# Altium schematic sheet RS485_RS232_Sheet.SchDoc
size A4; DocumentNumber: 6; SheetNumber: 6; SheetTotal: 10
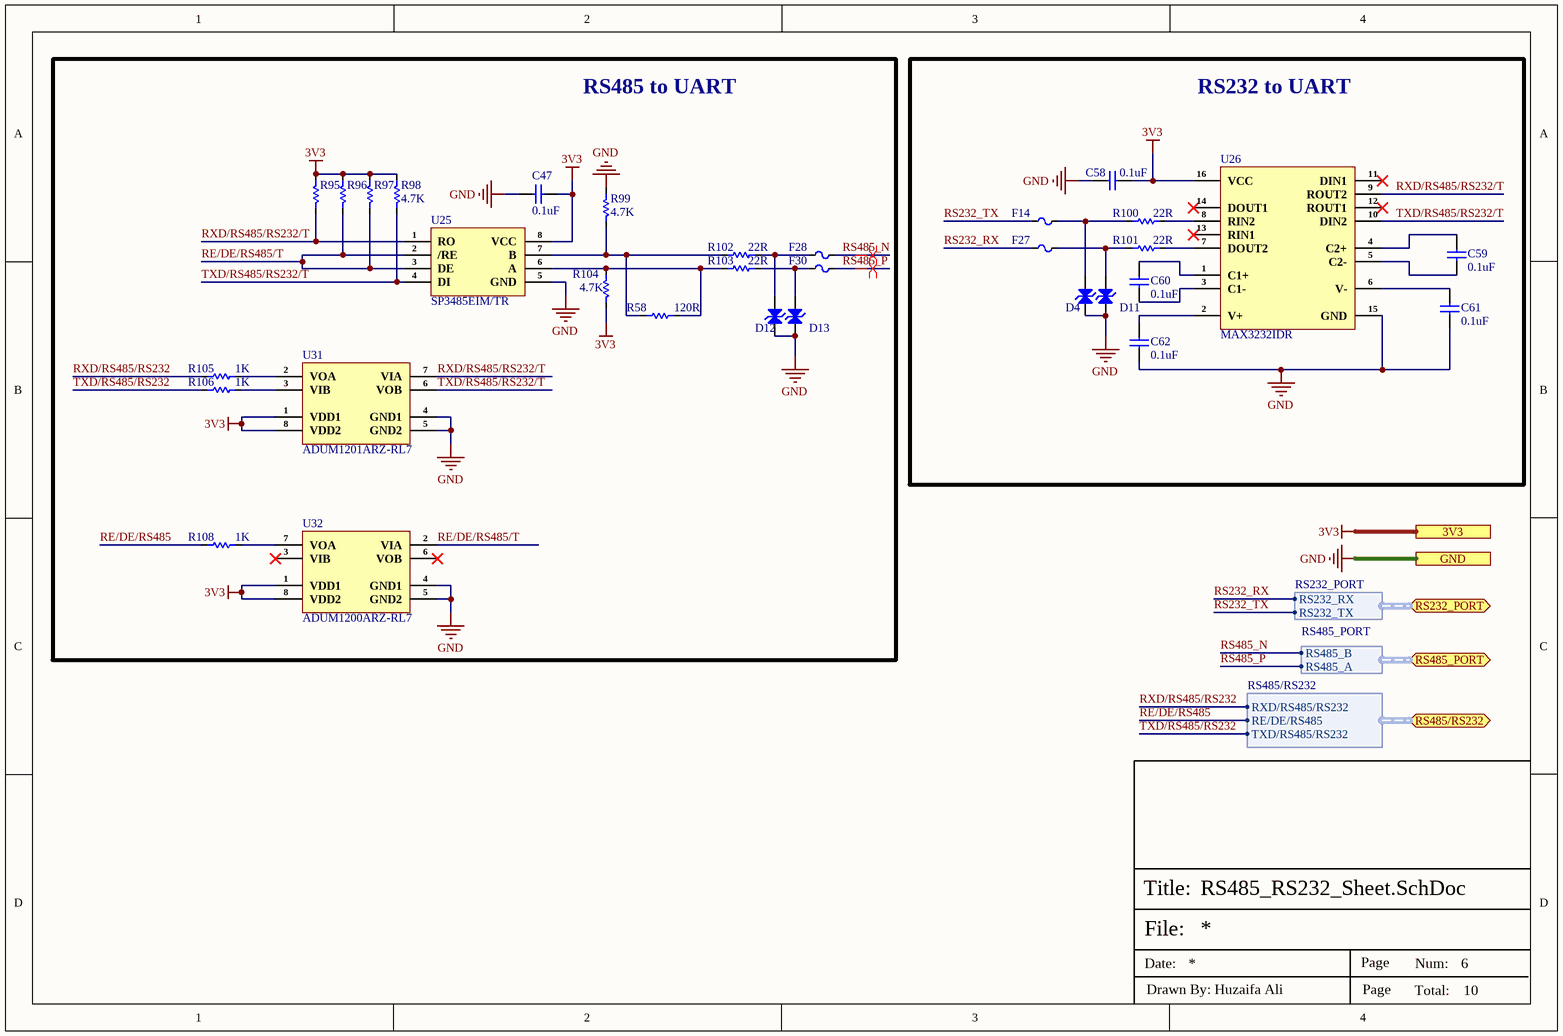
[diagram p0: RS485_RS232_Sheet.SchDoc]

## Parts
C47  0.1uF  [Cap-0603]
C58  0.1uF  [Cap-0603]
C59  0.1uF  [Cap-0603]
C60  0.1uF  [Cap-0603]
C61  0.1uF  [Cap-0603]
C62  0.1uF  [Cap-0603]
D4  SMBJ26CA  [SMB_]  (value not drawn)
D11  SMBJ26CA  [SMB_]  (value not drawn)
D12  SMBJ26CA  [SMB_]  (value not drawn)
D13  SMBJ26CA  [SMB_]  (value not drawn)
F14  SMD0805P020TF  [Fuse-0805]  (value not drawn)
F27  SMD0805P020TF  [Fuse-0805]  (value not drawn)
F28  SMD0805P020TF  [Fuse-0805]  (value not drawn)
F30  SMD0805P020TF  [Fuse-0805]  (value not drawn)
R58  120R  [Res-0603]
R95  4.7K  [Res-0603]  (value not drawn)
R96  4.7K  [Res-0603]  (value not drawn)
R97  4.7K  [Res-0603]  (value not drawn)
R98  4.7K  [Res-0603]
R99  4.7K  [Res-0603]
R100  22R  [Res-0603]
R101  22R  [Res-0603]
R102  22R  [Res-0603]
R103  22R  [Res-0603]
R104  4.7K  [Res-0603]
R105  1K  [Res-0603]
R106  1K  [Res-0603]
R108  1K  [Res-0603]
U25  SP3485EIM/TR  [SOP-8]
U26  MAX3232IDR  [SOIC-16]
U31  ADUM1201ARZ-RL7  [SOIC-8]
U32  ADUM1200ARZ-RL7  [SOIC-8]

## Blocks framed on the sheet
RS485 to UART: C47 D12 D13 F28 F30 R58 R95-R99 R102-R106 R108 U25 U31 U32
RS232 to UART: C58-C62 D4 D11 F14 F27 R100 R101 U26

## Ports
3V3, GND, RS232_PORT (bidir, harness RS232_PORT), RS485/RS232 (bidir, harness RS485/RS232), RS485_PORT (bidir, harness RS485_PORT)

## Harnesses
RS485_PORT: RS485_B, RS485_A
RS232_PORT: RS232_RX, RS232_TX
RS485/RS232: RXD/RS485/RS232, RE/DE/RS485, TXD/RS485/RS232

## Nets
3V3: C47.2 C58.2 R95.1 R96.1 R97.1 R98.1 R104.2 U25.8(VCC) U26.16(VCC) U31.1(VDD1) U31.8(VDD2) U32.1(VDD1) U32.8(VDD2) ; port 3V3
GND: C47.1 C58.1 C61.2 C62.2 D4.1(A) D11.1(A) D12.1(A) D13.1(A) R99.1 U25.5(GND) U26.15(GND) U31.4(GND1) U31.5(GND2) U32.4(GND1) U32.5(GND2) ; port GND
RE/DE/RS485: R108.2 ; port RS485/RS232.RE/DE/RS485
RE/DE/RS485/T: R96.2 R97.2 U25.2(/RE) U25.3(DE) U32.2(VIA)
RS232_RX: F27.1 ; port RS232_PORT.RS232_RX
RS232_TX: F14.1 ; port RS232_PORT.RS232_TX
RS485_N: F28.2 ; port RS485_PORT.RS485_B
RS485_P: F30.2 ; port RS485_PORT.RS485_A
RXD/RS485/RS232: R105.2 ; port RS485/RS232.RXD/RS485/RS232
RXD/RS485/RS232/T: R95.2 U25.1(RO) U26.9(ROUT2) U31.7(VIA)
TXD/RS485/RS232: R106.2 ; port RS485/RS232.TXD/RS485/RS232
TXD/RS485/RS232/T: R98.2 U25.4(DI) U26.10(DIN2) U31.6(VOB)
NetC59_1: C59.1 U26.4(C2+)
NetC59_2: C59.2 U26.5(C2-)
NetC60_1: C60.1 U26.1(C1+)
NetC60_2: C60.2 U26.3(C1-)
NetC61_1: C61.1 U26.6(V-)
NetC62_1: C62.1 U26.2(V+)
NetD4_2: D4.2(K) F14.2 R100.1
NetD11_2: D11.2(K) F27.2 R101.1
NetD12_2: D12.2(K) F28.1 R102.2
NetD13_2: D13.2(K) F30.1 R103.2
NetR58_1: R58.1 R99.2 R102.1 U25.7(B)
NetR58_2: R58.2 R103.1 R104.1 U25.6(A)
NetR100_2: R100.2 U26.8(RIN2)
NetR101_2: R101.2 U26.7(DOUT2)
NetR105_1: R105.1 U31.2(VOA)
NetR106_1: R106.1 U31.3(VIB)
NetR108_1: R108.1 U32.7(VOA)

Not connected (* = marked no-connect by the designer): U26 11(DIN1)* 12(ROUT1)* 13(RIN1)* 14(DOUT1)*; U32 3(VIB)* 6(VOB)*

## Layout directives
differential pair; net class RS485; differential pair class RS485_LINES; rule Impedance Constraint [Min = 115.0    Max = 120.0    ]; rule Matched Net Lengths [Tolerance = 0.508mm]: RS485_N, RS485_P

## Notes on the sheet
- File:
- Title:
- Date:
- Page
- Num:
- Total:
- Drawn By: Huzaifa Ali

## Library data of the parts
C47 C58-C62 = CC0603KRX5R9BB104: CAP CER 0.1UF 50V X5R 0603; Manufacturer: Yageo; Capacitance: 100nF; Tolerance: 10%; Item Type: Capacitor; Supplier 1: Digi-Key; Manufacturer Part Number: CC0603KRX5R9BB104; RoHS: Yes; Category: Ceramic Capacitors; Stock 1: 152253; Pricing 1: 1=0.10000, 10=0.05200, 50=0.02820, 100=0.02310, 500=0.01648, 1000=0.01294 (USD); Mount: Surface Mount; Case/Package: 0603; Case Code (Imperial): 0603; Case Code (Metric): 1608; Weight: 7.1E-05oz; Min Operating Temperature: -55°C; Max Operating Temperature: 85°C; Packaging: Tape and Reel; Voltage Rating: 50V; Dielectric: X5R; Termination: SMD/SMT; Voltage Rating (DC): 50V; Package Quantity: 4000; Length: 0.063inch; Width: 0.031inch; Thickness: 0.035inch; Lead Free: Lead Free; Halogen Free: Halogen Free; ComponentLink1URL: http://www.mouser.com/ds/2/447/Yageo_UPY-GP_NP0_16V-to-50V_9-358835.pdf?src-supplier=Mouser; ComponentLink1Description: http://www.mouser.com/ds/2/447/Yageo_UPY-GP_NP0_16V-to-50V_9-358835.pdf?src-supplier=Mouser; ComponentLink2URL: https://www.yageo.com/upload/media/product/productsearch/datasheet/mlcc/UPY-GPHC_X5R_4V-to-50V_26.pdf?src-supplier=Digi-Key; ComponentLink2Description: https://www.yageo.com/upload/media/product/productsearch/datasheet/mlcc/UPY-GPHC_X5R_4V-to-50V_26.pdf?src-supplier=Digi-Key; ComponentLink3URL: http://www.yageo.com/exep/pages/download/literatures/ProductSelectionGuide%202014_Final_2.pdf?src-supplier=Digi-Key; ComponentLink3Description: http://www.yageo.com/exep/pages/download/literatures/ProductSelectionGuide%202014_Final_2.pdf?src-supplier=Digi-Key; Supplier Part Number 1: 311-4046-1-ND; LCSC Part Number: C110022
D4 D11-D13 = SMBJ26CA: SMB(DO-214AA) TVS ROHS; Manufacturer: MSKSEMI; Item Type: Diode; Manufacturer Part Number: SMBJ26CA; Package: SMB(DO-214AA); LCSC Part Number: C5331111; ComponentLink1Description: LCSC; ComponentLink1URL: https://www.lcsc.com/product-detail/TVS_MSKSEMI-SMBJ26CA_C5331111.html
F14 F27 F28 F30 = SMD0805P020TF: 9V 200mA 100A 500mA 0805 Resettable Fuses ROHS; Manufacturer: RUILON; Item Type: Fuse; Manufacturer Part Number: SMD0805P020TF; Package: 0805; LCSC Part Number: C20976; ComponentLink1Description: LCSC; ComponentLink1URL: https://www.lcsc.com/product-detail/Resettable-Fuses_RUILON-Shenzhen-Ruilongyuan-Elec-SMD0805P020TF_C20976.html
R58 = RC0603FR-07120RL: RES 120 OHM 1% 1/10W 0603; Manufacturer: Yageo; Temperature Coefficient: 100ppm/°C; Voltage Rating (DC): 50V; Power Rating: 100mW; Supplier 1: Digi-Key; Manufacturer Part Number: RC0603FR-07120RL; RoHS: Yes; Category: Chip SMD Resistors; Stock 1: 839061; Pricing 1: 1=0.10000, 10=0.02400, 100=0.00970, 1000=0.00436, 2500=0.00378 (USD); Case/Package: 0603; Number of Pins: 2; Case Code (Metric): 1608; Case Code (Imperial): 0603; Size Code: 0603; Min Operating Temperature: -55°C; Max Operating Temperature: 155°C; Resistance: 120R; Tolerance: 1%; Resistor Type: Thick Film; Packaging: Tape and Reel; Voltage Rating: 50V; Package Quantity: 1; Number of Terminations: 2; Termination: SMD/SMT; Max Power Dissipation: 100mW; Features: Moisture Resistant; Series: RC; Construction: Rectangular; Resistance Tolerance: 1%; Length: 1.6mm; Width: 0.031inch; Height: 0.022inch; Depth: 0.8mm; REACH SVHC: No SVHC; Lead Free: Lead Free; Military Standard: Not; RoHS Compliant: Yes; ComponentLink1URL: https://datasheet.ciiva.com/2553/pyu-r-int-thick-7-2553512.pdf?src-supplier=Digi-Key; ComponentLink1Description: https://datasheet.ciiva.com/2553/pyu-r-int-thick-7-2553512.pdf?src-supplier=Digi-Key; ComponentLink2URL: https://datasheet.ciiva.com/7746/443971-7746248.pdf?src-supplier=Element14; ComponentLink2Description: https://datasheet.ciiva.com/7746/443971-7746248.pdf?src-supplier=Element14; ComponentLink3URL: https://datasheet.ciiva.com/2553/pyu-r-int-thick-7-2553513.pdf?src-supplier=Digi-Key; ComponentLink3Description: https://datasheet.ciiva.com/2553/pyu-r-int-thick-7-2553513.pdf?src-supplier=Digi-Key; ComponentLink4URL: https://datasheet.ciiva.com/7746/443971-7746249.pdf?src-supplier=Element14; ComponentLink4Description: https://datasheet.ciiva.com/7746/443971-7746249.pdf?src-supplier=Element14; ComponentLink5URL: https://datasheet.ciiva.com/2553/pyu-r-int-thick-7-2553514.pdf?src-supplier=Digi-Key; ComponentLink5Description: https://datasheet.ciiva.com/2553/pyu-r-int-thick-7-2553514.pdf?src-supplier=Digi-Key; ComponentLink6URL: https://datasheet.ciiva.com/46395/443971-46395021.pdf?src-supplier=Element14; ComponentLink6Description: https://datasheet.ciiva.com/46395/443971-46395021.pdf?src-supplier=Element14; Supplier Part Number 1: 311-120HRCT-ND; LCSC Part Number: C114640
R95-R99 R104 = RC0603JR-074K7L: RES SMD 4.7K OHM 5% 1/10W 0603; Manufacturer: Yageo; Resistance: 4.7kR; Temperature Coefficient: 100ppm/°C; Voltage Rating (DC): 50V; Power Rating: 100mW; Item Type: Resistor; Supplier 1: Digi-Key; Manufacturer Part Number: RC0603JR-074K7L; Stock 1: 19706643; Pricing 1: 1=0.1, 10=0.02, 100=0.0081, 1000=0.00362, 2500=0.00314 (USD); Case/Package: 0603; Number of Pins: 2; Case Code (Imperial): 0603; Case Code (Metric): 1608; Min Operating Temperature: -55°C; Max Operating Temperature: 155°C; Tolerance: 5%; Composition: Thick Film; Packaging: Tape and Reel; Voltage Rating: 50V; Termination: SMD/SMT; Military Standard: Not; Length: 1.6mm; Width: 0.8mm; Depth: 0.8mm; REACH SVHC: No SVHC; Lead Free: Lead Free; ComponentLink1URL: http://www.farnell.com/datasheets/443971.pdf?src-supplier=Element14; ComponentLink1Description: http://www.farnell.com/datasheets/443971.pdf?src-supplier=Element14; Supplier Part Number 1: 311-4.7KGRCT-ND; LCSC Part Number: C105428
R100-R103 = RC0603FR-0722RL: RES 22 OHM 1% 1/10W 0603; Manufacturer: Yageo; Temperature Coefficient: 100ppm/°C; Voltage Rating (DC): 50V; Power Rating: 100mW; Item Type: Resistor; Supplier 1: Avnet; Manufacturer Part Number: RC0603FR-0722RL; RoHS: Yes; Category: Chip SMD Resistors; Stock 1: 190000; Pricing 1: 5000=0.00133, 10000=0.00131, 20000=0.00127 (USD); Case/Package: 0603; Number of Pins: 2; Case Code (Metric): 1608; Case Code (Imperial): 0603; Size Code: 0603; Min Operating Temperature: -55°C; Max Operating Temperature: 155°C; Tolerance: 1%; Resistance: 22R; Resistor Type: Thick Film; Packaging: Tape and Reel; Voltage Rating: 50V; Package Quantity: 1; Number of Terminations: 2; Termination: SMD/SMT; Max Power Dissipation: 100mW; Features: Moisture Resistant; Series: RC; Resistance Tolerance: 1%; Technology: THICK FILM; Construction: Rectangular; Length: 0.063inch; Width: 0.031inch; Height: 0.022inch; Depth: 0.8mm; Reach SVHC Compliant: Yes; Lead Free: Lead Free; Military Standard: Not; RoHS Compliant: Yes; ComponentLink1URL: https://datasheet.ciiva.com/11819/0900766b80f96399-11819285.pdf?src-supplier=RSComponents; ComponentLink1Description: https://datasheet.ciiva.com/11819/0900766b80f96399-11819285.pdf?src-supplier=RSComponents; ComponentLink2URL: https://datasheet.ciiva.com/46395/443971-46395032.pdf?src-supplier=Element14; ComponentLink2Description: https://datasheet.ciiva.com/46395/443971-46395032.pdf?src-supplier=Element14; ComponentLink3URL: https://datasheet.ciiva.com/46440/1868787-46440901.pdf?src-supplier=Element14; ComponentLink3Description: https://datasheet.ciiva.com/46440/1868787-46440901.pdf?src-supplier=Element14; ComponentLink4URL: https://datasheet.ciiva.com/2454/pyu-r-int-thick-7-2454355.pdf?src-supplier=Digi-Key; ComponentLink4Description: https://datasheet.ciiva.com/2454/pyu-r-int-thick-7-2454355.pdf?src-supplier=Digi-Key; ComponentLink5URL: https://datasheet.ciiva.com/2454/pyu-r-int-thick-7-2454356.pdf?src-supplier=Digi-Key; ComponentLink5Description: https://datasheet.ciiva.com/2454/pyu-r-int-thick-7-2454356.pdf?src-supplier=Digi-Key; ComponentLink6URL: https://datasheet.ciiva.com/2454/pyu-r-int-thick-7-2454354.pdf?src-supplier=Digi-Key; ComponentLink6Description: https://datasheet.ciiva.com/2454/pyu-r-int-thick-7-2454354.pdf?src-supplier=Digi-Key; Supplier Part Number 1: RC0603FR-0722RL; LCSC Part Number: C107701
R105 R106 R108 = RC0603FR-071KL: RES SMD 1K OHM 1% 1/10W 0603; Manufacturer: Yageo; Resistance: 1kR; Temperature Coefficient: 100ppm/°C; Power Rating: 100mW; Voltage Rating: 50V; Item type: Resistor; ComponentLink1URL: https://www.verical.com/server-webapp/html/getDatasheet?partID=409289&src-supplier=Verical; ComponentLink1Description: https://www.verical.com/server-webapp/html/getDatasheet?partID=409289&src-supplier=Verical; Supplier 1: Digi-Key; Manufacturer Part Number: RC0603FR-071KL; Stock 1: 21472395; Pricing 1: 1=0.1, 10=0.023, 100=0.0094, 1000=0.0042, 2500=0.0037 (USD); Case/Package: 0603; Contact Plating: Tin,Matte; Case Code (Imperial): 0603; Case Code (Metric): 1608; Min Operating Temperature: -55°C; Max Operating Temperature: 155°C; Tolerance: 1%; Composition: Thick Film; Packaging: Tape and Reel; Termination: SMD/SMT; Military Standard: Not; Length: 1.6mm; Height: 0.45mm; Depth: 0.8mm; Radiation Hardening: No; REACH SVHC: No SVHC; Lead Free: Lead Free; ComponentLink2URL: http://documents.rs-components.com/techlib://itc_doclist_GB.htm?stockno=5048928&src-supplier=RSComponents; ComponentLink2Description: http://documents.rs-components.com/techlib://itc_doclist_GB.htm?stockno=5048928&src-supplier=RSComponents; ComponentLink3URL: http://www.yageo.com/documents/recent/PYu-RC0603_51_RoHS_L_4.pdf?src-supplier=Avnet+Europe; ComponentLink3Description: http://www.yageo.com/documents/recent/PYu-RC0603_51_RoHS_L_4.pdf?src-supplier=Avnet+Europe; ComponentLink4URL: http://www.farnell.com/datasheets/2167052.pdf?src-supplier=Element14; ComponentLink4Description: http://www.farnell.com/datasheets/2167052.pdf?src-supplier=Element14; ComponentLink5URL: http://www.farnell.com/datasheets/1868787.pdf?src-supplier=Element14; ComponentLink5Description: http://www.farnell.com/datasheets/1868787.pdf?src-supplier=Element14; ComponentLink6URL: http://www.yageo.com/documents/recent/PYu-RC_Group_51_RoHS_L_2.pdf?src-supplier=Avnet; ComponentLink6Description: http://www.yageo.com/documents/recent/PYu-RC_Group_51_RoHS_L_2.pdf?src-supplier=Avnet; ComponentLink7URL: https://www.verical.com/server-webapp/html/getDatasheet?partID=404327&src-supplier=Verical; ComponentLink7Description: https://www.verical.com/server-webapp/html/getDatasheet?partID=404327&src-supplier=Verical; ComponentLink8URL: http://www.farnell.com/datasheets/443971.pdf?src-supplier=Element14; ComponentLink8Description: http://www.farnell.com/datasheets/443971.pdf?src-supplier=Element14; Supplier Part Number 1: 311-1.00KHRDKR-ND; LCSC Part Number: C22548
U25 = SP3485EIM/TR: SOP-8 RS-485/RS-422 ICs ROHS; Manufacturer: HGSEMI; Item Type: IC; Manufacturer Part Number: SP3485EIM/TR; Package: SOP-8; LCSC Part Number: C519086; ComponentLink1Description: LCSC; ComponentLink1URL: https://www.lcsc.com/product-detail/RS-485-RS-422-ICs_HGSEMI-SP3485EIM-TR_C519086.html
U26 = MAX3232IDR: IC TRANSCEIVER FULL 2/2 16SOIC; Manufacturer: Texas Instruments; Min Supply Voltage: 3V; Max Supply Voltage: 5.5V; Data Rate: 250Kbps; Number of Receivers: 2; Operating Supply Voltage: 5V; Logic Function: Transceiver,Receiver; Number of Transceivers: 1; Supply Current: 1mA; Simplex/Duplex: Full Duplex; Receiver Hysteresis: 300mV; Supplier 1: Mouser; Manufacturer Part Number: MAX3232IDR; RoHS: Yes; Category: Interface ICs; Stock 1: 22181; Pricing 1: 1=2.37, 10=2.37, 50=2.37, 100=2.37, 1000=2.37, 10000=2.37 (USD); Mounting Technology: Surface Mount; Case/Package: D; Pins: 16; Weight: 0.004998oz; Min Operating Temperature: -40°C; Max Operating Temperature: 85°C; Packaging: Tape and Reel; Package Quantity: 1; Number of Transmitters: 2; Number of Drivers: 2; Series: -; Operating Supply Current: 1mA; Lead Free: Lead Free; RoHS Compliant: Yes; Reach SVHC Compliant: No; ComponentLink1URL: https://datasheet.ciiva.com/8064/1882754-8064745.pdf?src-supplier=Element14; ComponentLink1Description: https://datasheet.ciiva.com/8064/1882754-8064745.pdf?src-supplier=Element14; ComponentLink2URL: https://datasheet.ciiva.com/46394/1882754-46394523.pdf?src-supplier=Element14; ComponentLink2Description: https://datasheet.ciiva.com/46394/1882754-46394523.pdf?src-supplier=Element14; ComponentLink3URL: https://datasheet.ciiva.com/46397/1882754-46397996.pdf?src-supplier=Element14; ComponentLink3Description: https://datasheet.ciiva.com/46397/1882754-46397996.pdf?src-supplier=Element14; ComponentLink4URL: https://datasheet.ciiva.com/1701/max3232-1701626.pdf?src-supplier=Digi-Key; ComponentLink4Description: https://datasheet.ciiva.com/1701/max3232-1701626.pdf?src-supplier=Digi-Key; ComponentLink5URL: https://datasheet.ciiva.com/1701/max3232-1701625.pdf?src-supplier=Digi-Key; ComponentLink5Description: https://datasheet.ciiva.com/1701/max3232-1701625.pdf?src-supplier=Digi-Key; ComponentLink6URL: https://datasheet.ciiva.com/1701/max3232-1701627.pdf?src-supplier=Digi-Key; ComponentLink6Description: https://datasheet.ciiva.com/1701/max3232-1701627.pdf?src-supplier=Digi-Key; Supplier Part Number 1: 595-MAX3232IDR; LCSC Part Number: C18261; Item Type: IC
U31 = ADUM1201ARZ-RL7: DGTL ISO 2.5KV GEN PURP 8SOIC; Manufacturer: Analog Devices; Number of Channels: 2; Propagation Delay: 150ns; Min Supply Voltage: 2.7V; Max Supply Voltage: 5.5V; Data Rate: 25Mbps; Channel Type: Unidirectional; Polarity: Bidirectional; Operating Supply Current: 600uA; ESD Protection: No; Output Current: 35mA; Pulse Width Distortion (PWD): 40ns; Voltage: 5V; Approvals: UL,CSA,VDE; Item Type: IC; Supplier 1: Arrow Electronics; Manufacturer Part Number: ADUM1201ARZ-RL7; RoHS: Yes; Category: Interface ICs; Stock 1: 710; Pricing 1: 1=3.9521, 10=3.5429, 25=3.3533, 100=2.9042, 250=2.7545, 500=2.475, 1000=2.2037 (USD); Case/Package: R; Pins: 8; Weight: 0.019048oz; Min Operating Temperature: -40°C; Max Operating Temperature: 125°C; Packaging: Tape and Reel; Turn-On Delay Time: 150ns; Isolated Power: No; Type: General Purpose; Max Supply Current: 600uA; Series: iCoupler®; Radiation Hardening: No; Lead Free: Contains Lead; RoHS Compliant: Yes; ComponentLink1URL: https://datasheet.ciiva.com/15119/getdatasheetpartid-121048-15119389.pdf?src-supplier=Verical; ComponentLink1Description: https://datasheet.ciiva.com/15119/getdatasheetpartid-121048-15119389.pdf?src-supplier=Verical; ComponentLink2URL: https://datasheet.ciiva.com/15367/adum1200-1201-279454-15367752.pdf?src-supplier=Mouser; ComponentLink2Description: https://datasheet.ciiva.com/15367/adum1200-1201-279454-15367752.pdf?src-supplier=Mouser; ComponentLink3URL: https://datasheet.ciiva.com/3149/adum1200-1201-3149740.pdf?src-supplier=Avnet; ComponentLink3Description: https://datasheet.ciiva.com/3149/adum1200-1201-3149740.pdf?src-supplier=Avnet; ComponentLink4URL: https://datasheet.ciiva.com/3148/adum1200-1201-3148345.pdf?src-supplier=Avnet; ComponentLink4Description: https://datasheet.ciiva.com/3148/adum1200-1201-3148345.pdf?src-supplier=Avnet; ComponentLink5URL: https://datasheet.ciiva.com/2081/adum1200-1201-2081793.pdf?src-supplier=Digi-Key; ComponentLink5Description: https://datasheet.ciiva.com/2081/adum1200-1201-2081793.pdf?src-supplier=Digi-Key; ComponentLink6URL: https://datasheet.ciiva.com/2081/adum1200-1201-2081794.pdf?src-supplier=Digi-Key; ComponentLink6Description: https://datasheet.ciiva.com/2081/adum1200-1201-2081794.pdf?src-supplier=Digi-Key; ComponentLink7URL: https://datasheet.ciiva.com/2081/adum1200-1201-2081792.pdf?src-supplier=Digi-Key; ComponentLink7Description: https://datasheet.ciiva.com/2081/adum1200-1201-2081792.pdf?src-supplier=Digi-Key; Supplier Part Number 1: ADUM1201ARZ-RL7; LCSC Part Number: C9669
U32 = ADUM1200ARZ-RL7: DGTL ISO 2.5KV GEN PURP 8SOIC; Manufacturer: Analog Devices; Number of Channels: 2; Propagation Delay: 150ns; Min Supply Voltage: 2.7V; Operating Supply Voltage: 3.3V; Max Supply Voltage: 5.5V; Data Rate: 25Mbps; Channel Type: Unidirectional; Output Current: 35mA; Isolated Power: No; Pulse Width Distortion (PWD): 40ns; Supply Current: 600uA; Item Type: IC; Supplier 1: Arrow Electronics; Manufacturer Part Number: ADUM1200ARZ-RL7; RoHS: Yes; Category: Interface ICs; Stock 1: 14777; Pricing 1: 1=3.887, 10=3.493, 25=3.295, 100=2.865, 250=2.706, 500=2.425, 1000=2.066, 3000=2.048, 6000=2.025 (USD); Case/Package: R; Pins: 8; Min Operating Temperature: -40°C; Max Operating Temperature: 125°C; Packaging: Tape and Reel; Package Quantity: 1000; Turn-On Delay Time: 150ns; Type: General Purpose; Series: iCoupler®; Radiation Hardening: No; Lead Free: Contains Lead; RoHS Compliant: Yes; ComponentLink1URL: https://datasheet.ciiva.com/15119/getdatasheetpartid-258305-15119482.pdf?src-supplier=Verical; ComponentLink1Description: https://datasheet.ciiva.com/15119/getdatasheetpartid-258305-15119482.pdf?src-supplier=Verical; ComponentLink2URL: https://datasheet.ciiva.com/30514/1805054-30514023.pdf?src-supplier=Jameco; ComponentLink2Description: https://datasheet.ciiva.com/30514/1805054-30514023.pdf?src-supplier=Jameco; ComponentLink3URL: https://datasheet.ciiva.com/3148/adum1200-1201-3148342.pdf?src-supplier=Avnet; ComponentLink3Description: https://datasheet.ciiva.com/3148/adum1200-1201-3148342.pdf?src-supplier=Avnet; ComponentLink4URL: https://datasheet.ciiva.com/2081/adum1200-1201-2081796.pdf?src-supplier=Digi-Key; ComponentLink4Description: https://datasheet.ciiva.com/2081/adum1200-1201-2081796.pdf?src-supplier=Digi-Key; ComponentLink5URL: https://datasheet.ciiva.com/2081/adum1200-1201-2081797.pdf?src-supplier=Digi-Key; ComponentLink5Description: https://datasheet.ciiva.com/2081/adum1200-1201-2081797.pdf?src-supplier=Digi-Key; ComponentLink6URL: https://datasheet.ciiva.com/2081/adum1200-1201-2081795.pdf?src-supplier=Digi-Key; ComponentLink6Description: https://datasheet.ciiva.com/2081/adum1200-1201-2081795.pdf?src-supplier=Digi-Key; Supplier Part Number 1: ADUM1200ARZ-RL7; LCSC Part Number: C15219